# Altium schematic sheet signal-light-1.SchDoc
size A4; SheetNumber: 4; SheetTotal: 21
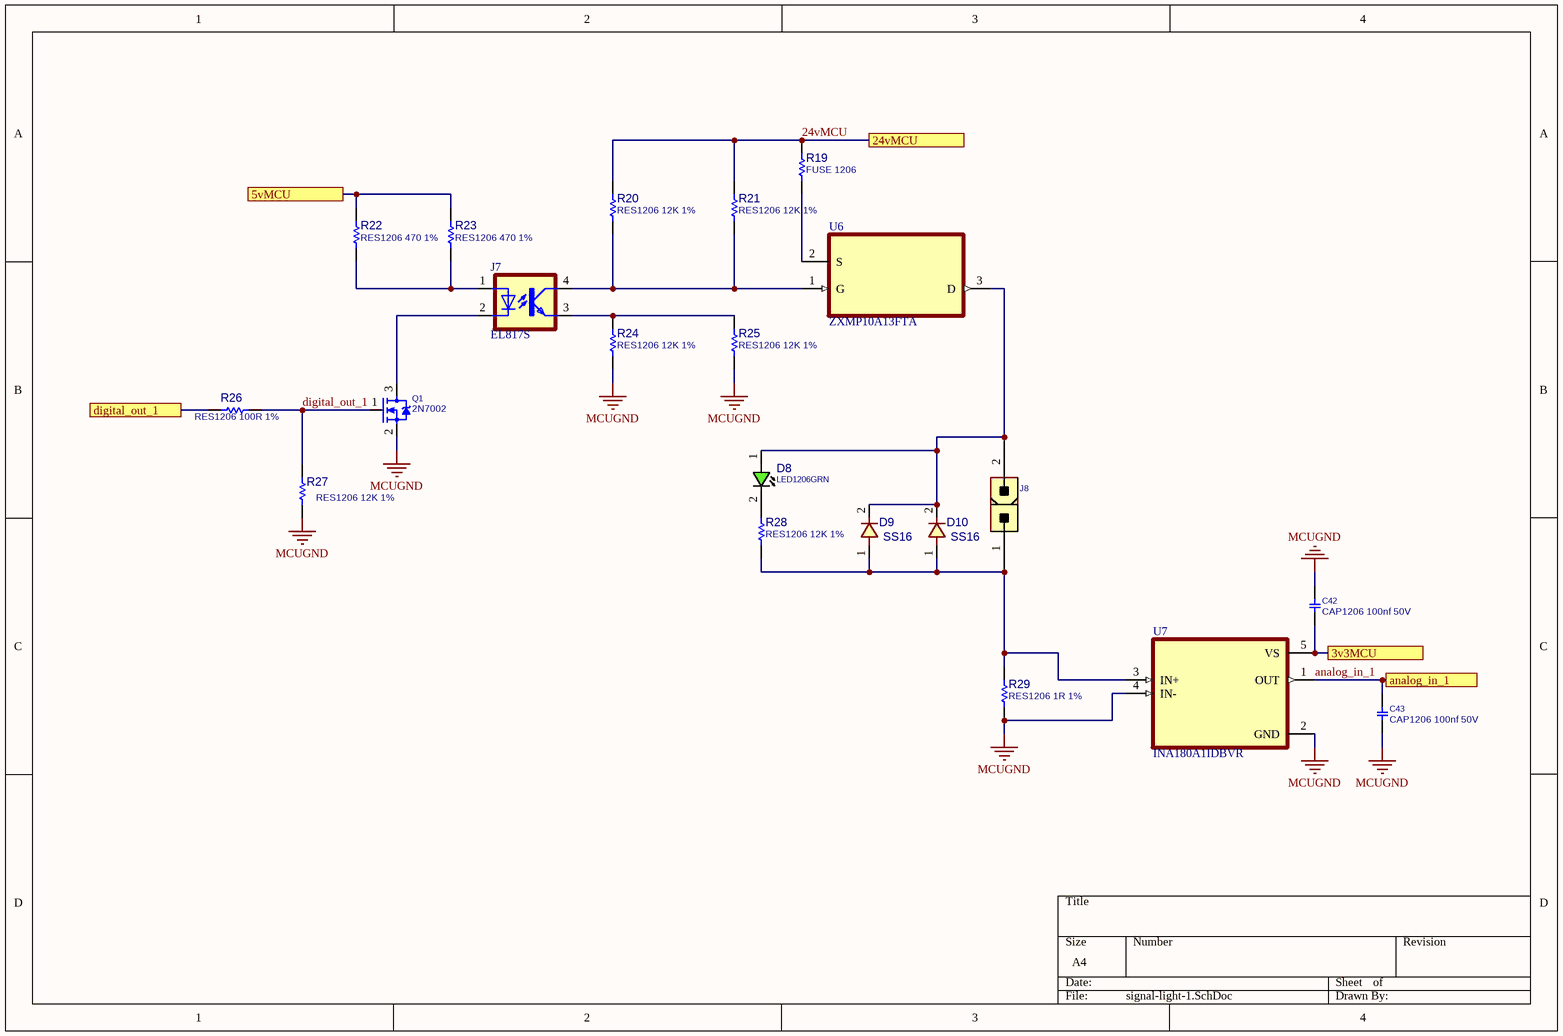
[diagram p0: signal-light-1.SchDoc]

## Parts
C42  CAP1206 100nf 50V  [C1206]
C43  CAP1206 100nf 50V  [C1206]
D8  LED1206GRN  [LED1206GRN]
D9  SS16  [D_SMA]
D10  SS16  [D_SMA]
J7  EL817S  [SOIC254P1030X460-4N]
J8  CONN_ATXPWR_2  [ATXPWR_2]  (value not drawn)
Q1  2N7002  [SOT23_3]
R19  FUSE 1206  [R1206]
R20  RES1206 12K 1%  [R1206]
R21  RES1206 12K 1%  [R1206]
R22  RES1206 470 1%  [R1206]
R23  RES1206 470 1%  [R1206]
R24  RES1206 12K 1%  [R1206]
R25  RES1206 12K 1%  [R1206]
R26  RES1206 100R 1%  [R1206]
R27  RES1206 12K 1%  [R1206]
R28  RES1206 12K 1%  [R1206]
R29  RES1206 1R 1%  [R1206]
U6  ZXMP10A13FTA  [SOT95P230X110-3N]
U7  INA180A1IDBVR  [SOT95P280X145-5N]

## Ports
3v3MCU, 5vMCU, 24vMCU, analog_in_1, digital_out_1

## Nets
MCUGND: C42.1 C43.2 Q1.2(SOURCE) R24.2 R25.2 R27.2 R29.2 U7.2(GND) U7.4(IN-)
3v3MCU: C42.2 U7.5(VS) ; port 3v3MCU
5vMCU: R22.2 R23.2 ; port 5vMCU
24vMCU: R19.1 R20.1 R21.1 ; port 24vMCU
analog_in_1: C43.1 U7.1(OUT) ; port analog_in_1
digital_out_1: Q1.1(GATE) R26.2 R27.1
digital_out_1: R26.1 ; port digital_out_1  [a separate net that carries the same name]
NetD8_1: D8.1(ANODE) D9.2 D10.2 J8.2 U6.3(D)
NetD8_2: D8.2(CATHODE) R28.1
NetD9_1: D9.1 D10.1 J8.1 R28.2 R29.1 U7.3(IN+)
NetJ7_1: J7.1(A) R22.1 R23.1
NetJ7_2: J7.2(C) Q1.3(DRAIN)
NetJ7_3: J7.3(EMIT) R24.1 R25.1
NetJ7_4: J7.4(COL) R20.2 R21.2 U6.1(G)
NetR19_2: R19.2 U6.2(S)

## Library data of the parts
C42 C43 = CAP_SMD_MLCC_1206: CAP, MLCC; PARAM: -, -%; MANF_P#: MANF_PART#; PARAM2: -V; PRICE: 100= 1$; MANF: -; ASSEMBLY: ASSEMBLY
D8 = LED_SMD_1206_GRN: LED, SMD, 1206, GREEN; PARAM: 20mA; DESC: DESCRIPTION; PARAM2: 2.2V; MANF: -; ASSEMBLY: ASSEMBLY; PRICE: 36t@Javan; MANF_P#: -; VALUE: LED1206GRN; MountType: SMT; PartType: LED
D9 D10 = DIODE_SMD_1N4001: DIODE, GENERAL PURPOSE, 50V/1A; DESC: DESCRIPTION; PARAM: 50V VRRM; PARAM2: 1A; MANF_P#: 1N4001; MANF: MANF; ASSEMBLY: ASSEMBLY; PRICE: PRICE; VALUE: SS16
J7 = EL817S: Optoisolator Transistor Output 5000Vrms 1 Channel 4-SMD; MF: Everlight Electronics; SnapEDA_Link: https://www.snapeda.com/parts/EL817S/Everlight+Electronics+Co+Ltd/view-part/?ref=snap; Package: SMD-4 Everlight Electronics Co Ltd; Value: *; MP: EL817S; Check_prices: https://www.snapeda.com/parts/EL817S/Everlight+Electronics+Co+Ltd/view-part/?ref=eda
J8 = CONN_ATXPWR_2: CONN, ATX POWER, 2 P; MANF: Molex; MANF_P#: 39281023; VALUE: CONN_ATXPWR_2; MountType: THD; PACKAGE: ATXPWR-2pin; Part Type: Conn.
Q1 = MOSN_2N7002_SOT23: MOSFET, N-CH, 60V, 0.3A; MANF: NXP; ASSEMBLY: ASSEMBLY; MANF_P#: 2N7002; PARAM2: 60v; PARAM: 0.3A; PRICE: 0.3t@Javan; VALUE: 2N7002
R19-R29 = RES_SMD_1206: RESISTOR, SMD; PARAM: 1%, 0.25W; DESC: DESCRIPTION; DIST#: MOUSER; MANF_P#: -; MANF: -; ASSEMBLY: ASSEMBLY; PRICE: -; PARAM2: -
U6 = ZXMP10A13FTA: P-Channel 100 V 600mA (Ta) 625mW (Ta) Surface Mount SOT-23-3; MF: Diodes Inc.; Purchase-URL: https://pricing.snapeda.com/search/part/ZXMP10A13FTA/?ref=eda; Package: SOT-23-3 Diodes Inc.; SnapEDA_Link: https://www.snapeda.com/parts/ZXMP10A13FTA/Diodes+Inc./view-part/?ref=snap; Availability: In Stock; Value: *; MP: ZXMP10A13FTA; Check_prices: https://www.snapeda.com/parts/ZXMP10A13FTA/Diodes+Inc./view-part/?ref=eda; Price: None
U7 = INA180A1IDBVR: 26V, 350kHz current sense amplifier; MF: Texas Instruments; SnapEDA_Link: https://www.snapeda.com/parts/INA180A1IDBVR/Texas+Instruments/view-part/?ref=snap; Package: SOT-23-5 Texas Instruments; Value: *; MP: INA180A1IDBVR; Check_prices: https://www.snapeda.com/parts/INA180A1IDBVR/Texas+Instruments/view-part/?ref=eda